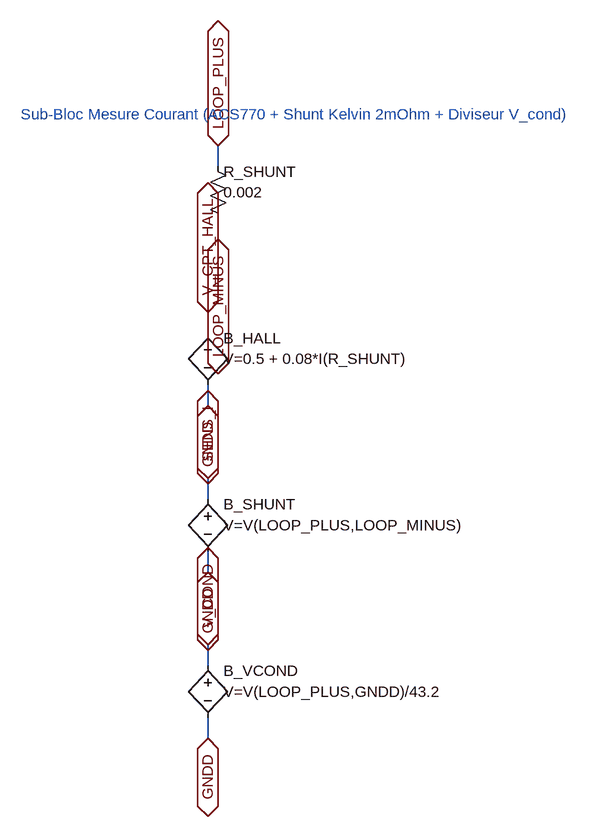
[diagram p0: schematic sub_mesure_courant.asc]
sub_mesure_courant.asc, the LTspice schematic file:
Version 4
SHEET 1 3200 2400
TEXT 32 32 Left 2 ;Sub-Bloc Mesure Courant (ACS770 + Shunt Kelvin 2mOhm + Diviseur V_cond)
SYMBOL res 320 96 R0
WINDOW 0 24 24 Left 2
WINDOW 3 24 56 Left 2
SYMATTR InstName R_SHUNT
SYMATTR Value 0.002
WIRE 336 112 336 80
FLAG 336 80 LOOP_PLUS
IOPIN 336 80 BiDir
WIRE 336 192 336 224
FLAG 336 224 LOOP_MINUS
IOPIN 336 224 BiDir
SYMBOL bv 320 352 R0
WINDOW 0 24 24 Left 2
WINDOW 3 24 56 Left 2
SYMATTR InstName B_HALL
SYMATTR Value V=0.5 + 0.08*I(R_SHUNT)
WIRE 320 368 320 336
FLAG 320 336 V_CPT_HALL
IOPIN 320 336 BiDir
WIRE 320 448 320 480
FLAG 320 480 GNDD
IOPIN 320 480 BiDir
SYMBOL bv 320 608 R0
WINDOW 0 24 24 Left 2
WINDOW 3 24 56 Left 2
SYMATTR InstName B_SHUNT
SYMATTR Value V=V(LOOP_PLUS,LOOP_MINUS)
WIRE 320 624 320 592
FLAG 320 592 SENS_I
IOPIN 320 592 BiDir
WIRE 320 704 320 736
FLAG 320 736 GNDD
IOPIN 320 736 BiDir
SYMBOL bv 320 864 R0
WINDOW 0 24 24 Left 2
WINDOW 3 24 56 Left 2
SYMATTR InstName B_VCOND
SYMATTR Value V=V(LOOP_PLUS,GNDD)/43.2
WIRE 320 880 320 848
FLAG 320 848 V_COND
IOPIN 320 848 BiDir
WIRE 320 960 320 992
FLAG 320 992 GNDD
IOPIN 320 992 BiDir

The netlist it stands for:
* sub_mesure_courant.asc
R_SHUNT LOOP_PLUS LOOP_MINUS 0.002
B_HALL V_CPT_HALL GNDD V=0.5 + 0.08*I(R_SHUNT)
B_SHUNT SENS_I GNDD V=V(LOOP_PLUS,LOOP_MINUS)
B_VCOND V_COND GNDD V=V(LOOP_PLUS,GNDD)/43.2
* Sub-Bloc Mesure Courant (ACS770 + Shunt Kelvin 2mOhm + Diviseur V_cond)
.backanno
.end